# Altium schematic sheet signal-light-5.SchDoc
size A4; SheetNumber: 8; SheetTotal: 21
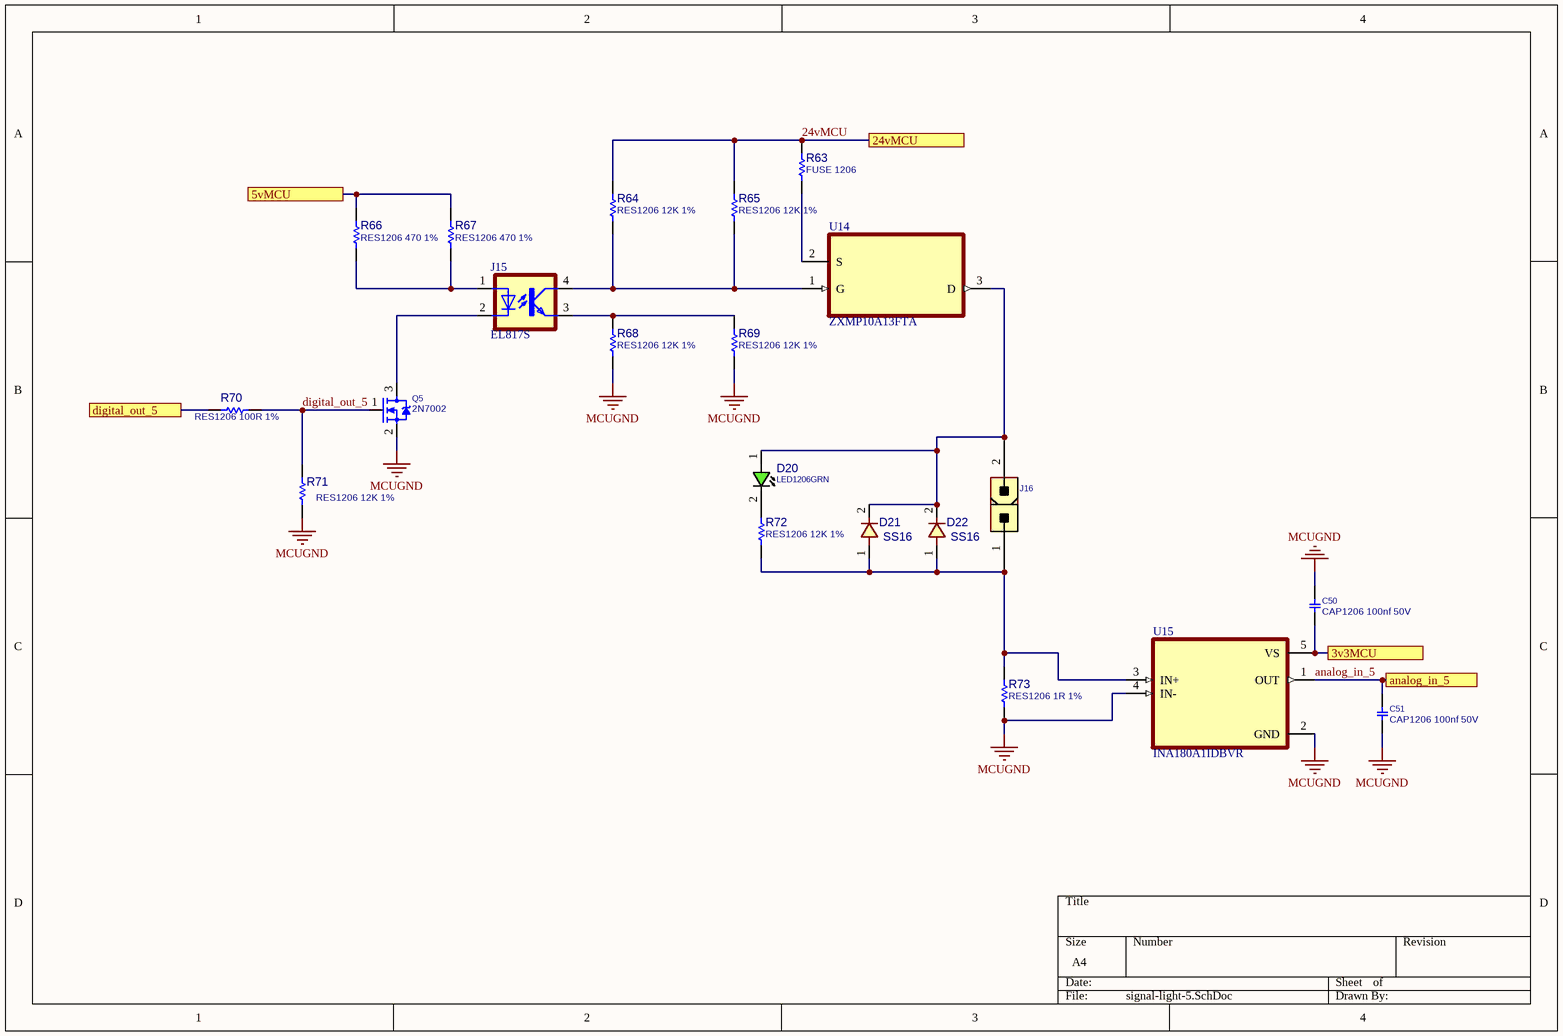
[diagram p0: signal-light-5.SchDoc]

## Parts
C50  CAP1206 100nf 50V  [C1206]
C51  CAP1206 100nf 50V  [C1206]
D20  LED1206GRN  [LED1206GRN]
D21  SS16  [D_SMA]
D22  SS16  [D_SMA]
J15  EL817S  [SOIC254P1030X460-4N]
J16  CONN_ATXPWR_2  [ATXPWR_2]  (value not drawn)
Q5  2N7002  [SOT23_3]
R63  FUSE 1206  [R1206]
R64  RES1206 12K 1%  [R1206]
R65  RES1206 12K 1%  [R1206]
R66  RES1206 470 1%  [R1206]
R67  RES1206 470 1%  [R1206]
R68  RES1206 12K 1%  [R1206]
R69  RES1206 12K 1%  [R1206]
R70  RES1206 100R 1%  [R1206]
R71  RES1206 12K 1%  [R1206]
R72  RES1206 12K 1%  [R1206]
R73  RES1206 1R 1%  [R1206]
U14  ZXMP10A13FTA  [SOT95P230X110-3N]
U15  INA180A1IDBVR  [SOT95P280X145-5N]

## Ports
3v3MCU, 5vMCU, 24vMCU, analog_in_5, digital_out_5

## Nets
MCUGND: C50.1 C51.2 Q5.2(SOURCE) R68.2 R69.2 R71.2 R73.2 U15.2(GND) U15.4(IN-)
3v3MCU: C50.2 U15.5(VS) ; port 3v3MCU
5vMCU: R66.2 R67.2 ; port 5vMCU
24vMCU: R63.1 R64.1 R65.1 ; port 24vMCU
analog_in_5: C51.1 U15.1(OUT) ; port analog_in_5
digital_out_5: Q5.1(GATE) R70.2 R71.1
digital_out_5: R70.1 ; port digital_out_5  [a separate net that carries the same name]
NetD20_1: D20.1(ANODE) D21.2 D22.2 J16.2 U14.3(D)
NetD20_2: D20.2(CATHODE) R72.1
NetD21_1: D21.1 D22.1 J16.1 R72.2 R73.1 U15.3(IN+)
NetJ15_1: J15.1(A) R66.1 R67.1
NetJ15_2: J15.2(C) Q5.3(DRAIN)
NetJ15_3: J15.3(EMIT) R68.1 R69.1
NetJ15_4: J15.4(COL) R64.2 R65.2 U14.1(G)
NetR63_2: R63.2 U14.2(S)

## Library data of the parts
C50 C51 = CAP_SMD_MLCC_1206: CAP, MLCC; PARAM: -, -%; MANF_P#: MANF_PART#; PARAM2: -V; PRICE: 100= 1$; MANF: -; ASSEMBLY: ASSEMBLY
D20 = LED_SMD_1206_GRN: LED, SMD, 1206, GREEN; PARAM: 20mA; DESC: DESCRIPTION; PARAM2: 2.2V; MANF: -; ASSEMBLY: ASSEMBLY; PRICE: 36t@Javan; MANF_P#: -; VALUE: LED1206GRN; MountType: SMT; PartType: LED
D21 D22 = DIODE_SMD_1N4001: DIODE, GENERAL PURPOSE, 50V/1A; DESC: DESCRIPTION; PARAM: 50V VRRM; PARAM2: 1A; MANF_P#: 1N4001; MANF: MANF; ASSEMBLY: ASSEMBLY; PRICE: PRICE; VALUE: SS16
J15 = EL817S: Optoisolator Transistor Output 5000Vrms 1 Channel 4-SMD; MF: Everlight Electronics; SnapEDA_Link: https://www.snapeda.com/parts/EL817S/Everlight+Electronics+Co+Ltd/view-part/?ref=snap; Package: SMD-4 Everlight Electronics Co Ltd; Value: *; MP: EL817S; Check_prices: https://www.snapeda.com/parts/EL817S/Everlight+Electronics+Co+Ltd/view-part/?ref=eda
J16 = CONN_ATXPWR_2: CONN, ATX POWER, 2 P; MANF: Molex; MANF_P#: 39281023; VALUE: CONN_ATXPWR_2; MountType: THD; PACKAGE: ATXPWR-2pin; Part Type: Conn.
Q5 = MOSN_2N7002_SOT23: MOSFET, N-CH, 60V, 0.3A; MANF: NXP; ASSEMBLY: ASSEMBLY; MANF_P#: 2N7002; PARAM2: 60v; PARAM: 0.3A; PRICE: 0.3t@Javan; VALUE: 2N7002
R63-R73 = RES_SMD_1206: RESISTOR, SMD; PARAM: 1%, 0.25W; DESC: DESCRIPTION; DIST#: MOUSER; MANF_P#: -; MANF: -; ASSEMBLY: ASSEMBLY; PRICE: -; PARAM2: -
U14 = ZXMP10A13FTA: P-Channel 100 V 600mA (Ta) 625mW (Ta) Surface Mount SOT-23-3; MF: Diodes Inc.; Purchase-URL: https://pricing.snapeda.com/search/part/ZXMP10A13FTA/?ref=eda; Package: SOT-23-3 Diodes Inc.; SnapEDA_Link: https://www.snapeda.com/parts/ZXMP10A13FTA/Diodes+Inc./view-part/?ref=snap; Availability: In Stock; Value: *; MP: ZXMP10A13FTA; Check_prices: https://www.snapeda.com/parts/ZXMP10A13FTA/Diodes+Inc./view-part/?ref=eda; Price: None
U15 = INA180A1IDBVR: 26V, 350kHz current sense amplifier; MF: Texas Instruments; SnapEDA_Link: https://www.snapeda.com/parts/INA180A1IDBVR/Texas+Instruments/view-part/?ref=snap; Package: SOT-23-5 Texas Instruments; Value: *; MP: INA180A1IDBVR; Check_prices: https://www.snapeda.com/parts/INA180A1IDBVR/Texas+Instruments/view-part/?ref=eda